# Altium project RK3588底板.PrjPcb (part 5 of 5)

## Sheet 12.SATA接口.SchDoc
size A4; SheetNumber: 12; SheetTotal: 13
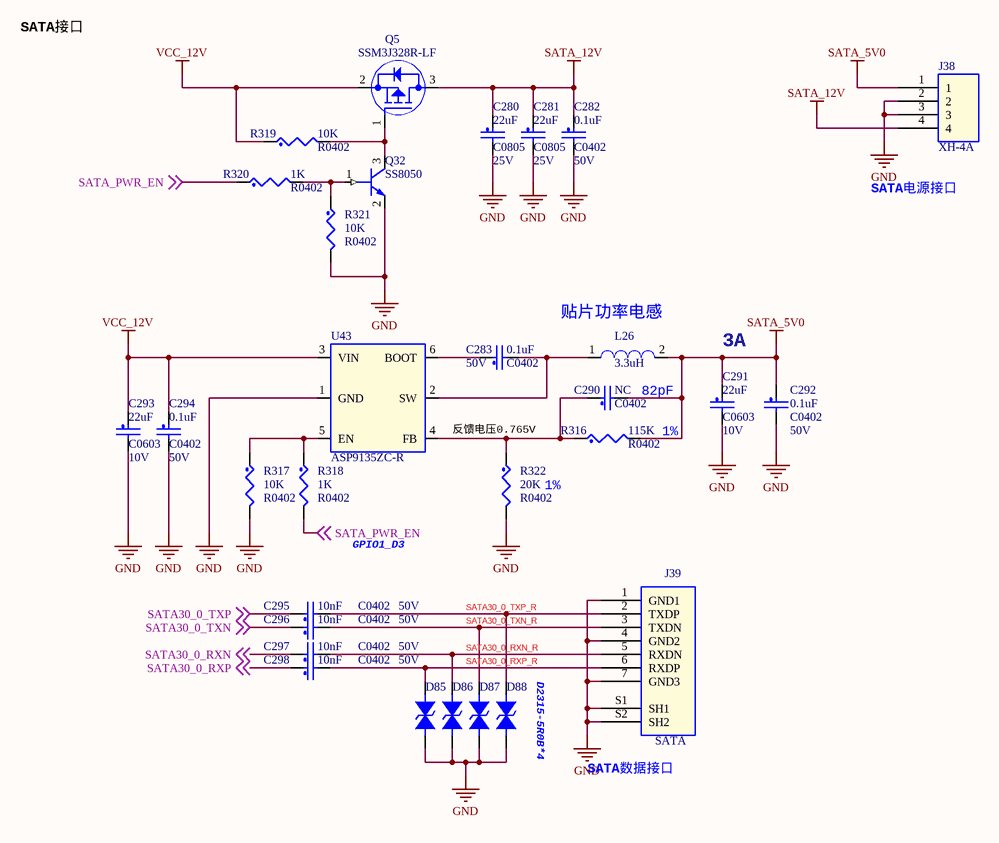
[diagram p11: 12.SATA接口.SchDoc]

### Parts
C280  22uF  Voltage: 25V  [C0805]
C281  22uF  Voltage: 25V  [C0805]
C282  0.1uF  Voltage: 50V  [C0402]
C283  0.1uF  Voltage: 50V  [C0402]
C290  NC  [C0402]
C291  22uF  Voltage: 10V  [C0603]
C292  0.1uF  Voltage: 50V  [C0402]
C293  22uF  Voltage: 10V  [C0603]
C294  0.1uF  Voltage: 50V  [C0402]
C295  10nF  Voltage: 50V  [C0402]
C296  10nF  Voltage: 50V  [C0402]
C297  10nF  Voltage: 50V  [C0402]
C298  10nF  Voltage: 50V  [C0402]
D85  D2315-5R0B  [esd0402]  (value not drawn)
D86  D2315-5R0B  [esd0402]  (value not drawn)
D87  D2315-5R0B  [esd0402]  (value not drawn)
D88  D2315-5R0B  [esd0402]  (value not drawn)
J38  XH-4A  [XH2p54-4p]
J39  SATA  [ssata_v]
L26  3.3uH  [l4520]
Q5  SSM3J328R-LF  [SOT23]
Q32  SS8050  [SOT23]
R316  115K  [R0402]
R317  10K  [R0402]
R318  1K  [R0402]
R319  10K  [R0402]
R320  1K  [R0402]
R321  10K  [R0402]
R322  20K  [R0402]
U43  ASP9135ZC-R  [SOT23_6]

### Nets
GND: C280.2 C281.2 C282.2 C291.2 C292.2 C293.2 C294.2 D85.1 D86.1 D87.1 D88.1 J38.2 J38.3 J39.1(GND1) J39.4(GND2) J39.7(GND3) J39.S1(SH1) J39.S2(SH2) Q32.2(EMITTER) R317.2 R321.2 R322.2 U43.1(GND)
SATA_5V0: C290.2 C291.1 C292.1 J38.1 L26.2 R316.2
SATA_12V: C280.1 C281.1 C282.1 J38.4 Q5.3(DRAIN)
VCC_12V: C293.1 C294.1 Q5.2(SOURCE) R319.1 U43.3(VIN)
SATA30_0_RXN: C297.1 ; off-sheet SATA30_0_RXN  [project net PCIE20_0_RXN]
SATA30_0_RXN_R: C297.2 D86.2 J39.5(RXDN)
SATA30_0_RXP: C298.1 ; off-sheet SATA30_0_RXP  [project net PCIE20_0_RXP]
SATA30_0_RXP_R: C298.2 D85.2 J39.6(RXDP)
SATA30_0_TXN: C296.1 ; off-sheet SATA30_0_TXN  [project net PCIE20_0_TXN]
SATA30_0_TXN_R: C296.2 D87.2 J39.3(TXDN)
SATA30_0_TXP: C295.1 ; off-sheet SATA30_0_TXP  [project net PCIE20_0_TXP]
SATA30_0_TXP_R: C295.2 D88.2 J39.2(TXDP)
SATA_PWR_EN: R318.2 R320.1 ; off-sheet SATA_PWR_EN  [project net GPIO1_D3]
NetC283_1: C283.1 U43.6(BOOT)
NetC283_2: C283.2 L26.1 U43.2(SW)
NetC290_1: C290.1 R316.1 R322.1 U43.4(FB)
NetQ5_1: Q5.1(GATE) Q32.3(COLLECTOR) R319.2
NetQ32_1: Q32.1(BASE) R320.2 R321.1
NetR317_1: R317.1 R318.1 U43.5(EN)

### Notes on the sheet
- SATA接口
- SATA电源接口
- (near L26) 贴片功率电感
- 3A
- 反馈电压0.765V
- 82pF
- 1%
- GPIO1_D3
- (near D88) D2315-5R0B*4
- (near J39) SATA数据接口

### Library data of the parts
C280 C281 = CAP_NP: CLASS: DISCRETE; 规格: 贴片电容22uF 20% 25V X5R 0805; 规格编号: 0805X226M250NT; 条码: EBF29060173; 品牌: 风华; 类别: 贴片电容0805; 规格书: 风华电容.pdf; 价格: 0.285631; 生命周期: 量产; PCB Footprint: C0805
C282 C283 = CAP_NP: CLASS: DISCRETE; 生命周期: 量产; 价格: 0.029826; 规格书: 风华电容.pdf; 类别: 贴片电容0402; 品牌: 风华; 条码: EBF29060118; 规格编号: 0402X104K500NT; 规格: 贴片电容0.1uF 10% 50V X5R 0402; PCB Footprint: C0402
C290 = CAP_NP: CLASS: DISCRETE; 规格: 贴片电容NC 预留; 条码: EBF29060149; 类别: 贴片电容0402; Voltage: NC; PCB Footprint: C0402
C291 C293 = CAP_NP: CLASS: DISCRETE; 生命周期: 量产; 价格: 0.078818; 规格书: 三星电容.pdf; 类别: 贴片电容0603; 品牌: 三星; 条码: EBF29060163; 规格编号: CL10A226MP8NUNE; 规格: 贴片电容22uF 20% 10V X5R 0603; PCB Footprint: C0603
C292 C294 = CAP_NP: CLASS: DISCRETE; 规格: 贴片电容0.1uF 10% 50V X5R 0402; 规格编号: 0402X104K500NT; 条码: EBF29060118; 品牌: 风华; 类别: 贴片电容0402; 规格书: 风华电容.pdf; 价格: 0.029826; 生命周期: 量产; PCB Footprint: C0402
C295-C298 = CAP_NP: CLASS: DISCRETE; 规格: 贴片电容10nF 10% 50V X7R 0402; 规格编号: CC0402KRX7R9BB103; 条码: EBF29060245; 品牌: 国巨; 类别: 贴片电容0402; 规格书: 国巨-贴片电容.pdf; 价格: 0.003808; 生命周期: 量产; PCB Footprint: C0402
D85-D88 = DIODE BI-DIR TRIG: 备注: 通用; 生命周期: 量产; 规格书: 千虹_D2315-5R0B.pdf; 类别: 贴片ESD; 品牌: 千虹; 条码: EBFCIS240517170922; 规格: 防静电保护ESD二极管 反向工作电压5V 击穿电压7V 钳位电压10.5V 结电容Cj 0.3pF; PCB Footprint: esd0402; 规格编号: D2315-5R0B
J38 = 1X4PIN: 可替代料: EBF29040012; 生命周期: 量产; 价格: 0.041116; 规格书: 博穆精密-XH2.54.pdf; 类别: XH连接器; 品牌: 博穆精密; 规格: 直针XH2.54-4P 间距2.54MM 拔插式 接插件 直插; PCB Footprint: XH2p54-4p; 条码: EBF29040012; 规格编号: XH-4A
J39 = SATA: 生命周期: 量产; 规格书: SATA_7PIN.pdf; 类别: SATA连接器; 品牌: 华宇创; 条码: EBF29040076; 规格编号: HYCW01-SATA07-205B; 规格: SATA 7PIN 全包开窗 A型; PCB Footprint: ssata_v
L26 = IND: CLASS: DISCRETE; 规格: 贴片电感3.3uH ±20% 3A 直流电阻69mΩ; 条码: EBF29050040; 品牌: 台庆; 类别: 贴片电感0402; 规格书: 台庆-功率电感.pdf; 生命周期: 量产; 规格编号: TMPC0402HP-3R3MG-Z02; 价格: 1.5992; PCB Footprint: l4520
Q5 = MOSFET_P: CLASS: IC; 丝印: KFH-XXX; 生命周期: 量产; 价格: 0.447836; 规格书: SSM3J328R-LF.pdf; 类别: P-MOS; 品牌: 东芝; 条码: EBF29280008; 规格编号: SSM3J328R LF; 规格: P沟道MOS 导通电阻29.8mΩ 电流3A 1.5V可驱动; PCB Footprint: SOT23
Q32 = NPN: CLASS: IC; 丝印: Y1; 生命周期: 量产; 价格: 0.086744; 规格书: 江苏长电-SS8050Y1.pdf; 类别: 贴片三极管SOT-23; 品牌: 江苏长电; 条码: EBF29090001; 规格: 贴片三极管SS8050 集电极电流1.5A 额定功率300mW NPN; PCB Footprint: SOT23; 规格编号: SS8050
R316 = RES: CLASS: DISCRETE; 规格: 贴片电阻115K 1% 1/16W 0402; 规格编号: AC0402FR-07115KL; 条码: EBF29070290; 品牌: 国巨; 类别: 贴片电阻0402; 规格书: YAGEO国巨厚膜无铅电阻.pdf; 价格: 0.006087; 生命周期: 量产; PCB Footprint: R0402
R317 R321 = RES: CLASS: DISCRETE; 生命周期: 量产; 价格: 0.002773; 规格书: 厚声-无铅厚膜电阻.pdf; 类别: 贴片电阻0402; 品牌: 厚声; 条码: EBF29070046; 规格编号: 0402WGF1002TCE; 规格: 贴片电阻10K 1% 1/16W 0402; PCB Footprint: R0402
R318 R320 = RES: CLASS: DISCRETE; 规格: 贴片电阻1K 1% 1/16W 0402; 规格编号: RI0402L1001FT; 条码: EBF29070050; 品牌: 合科泰; 类别: 贴片电阻0402; 规格书: 合科泰-RI系列电阻.pdf; 生命周期: 量产; PCB Footprint: R0402
R319 = RES: CLASS: DISCRETE; 规格: 贴片电阻10K 1% 1/16W 0402; 规格编号: 0402WGF1002TCE; 条码: EBF29070046; 品牌: 厚声; 类别: 贴片电阻0402; 规格书: 厚声-无铅厚膜电阻.pdf; 价格: 0.002773; 生命周期: 量产; PCB Footprint: R0402
R322 = RES: CLASS: DISCRETE; 规格: 贴片电阻20K 1% 1/16W 0402; 规格编号: 0402WGF2002TCE; 条码: EBF29070223; 品牌: 厚声; 类别: 贴片电阻0402; 规格书: 厚声-无铅厚膜电阻.pdf; 价格: 0.002473; 生命周期: 量产; PCB Footprint: R0402
U43 = TP6327GS6: 生命周期: 量产; 规格书: 安森德_ASP9135ZC-R.pdf; 类别: 电源管理-DCDC; 品牌: 安森德; 条码: EBFCIS240710113940; 规格: DC-DC电源芯片 可输出电流 3A 开关工作频率 600kHz 输出类型 ADJ 输入电压范围：4V-18V; 备注: RK3566金手指与BTB底板替换物料; 规格编号: ASP9135ZC-R; 可替代料: TP6327GS6; PCB Footprint: SOT23_6

## Sheet 13.GPIO扩展接口.SchDoc
size A4; SheetNumber: 13; SheetTotal: 13
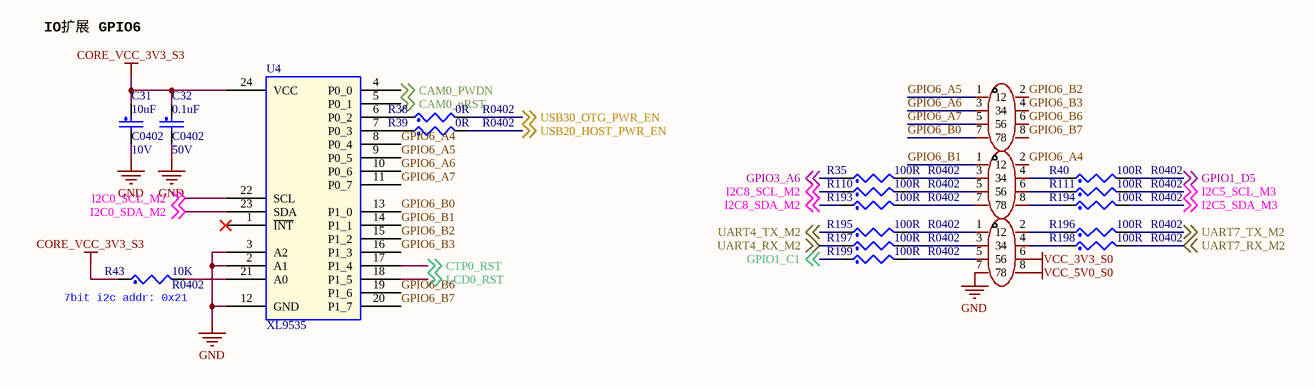
[diagram p12: 13.GPIO扩展接口.SchDoc]

### Parts
C31  10uF  Voltage: 10V  [C0402]
C32  0.1uF  Voltage: 50V  [C0402]
H1  HX PZ2.0-2x4P WT  [HDR-SMD_HX-PZ2.0-2X4P-WT]  (value not drawn)
H2  HX PZ2.0-2x4P WT  [HDR-SMD_HX-PZ2.0-2X4P-WT]  (value not drawn)
H3  HX PZ2.0-2x4P WT  [HDR-SMD_HX-PZ2.0-2X4P-WT]  (value not drawn)
R35  100R  [R0402]
R38  0R  [R0402]
R39  0R  [R0402]
R40  100R  [R0402]
R43  10K  [R0402]
R110  100R  [R0402]
R111  100R  [R0402]
R193  100R  [R0402]
R194  100R  [R0402]
R195  100R  [R0402]
R196  100R  [R0402]
R197  100R  [R0402]
R198  100R  [R0402]
R199  100R  [R0402]
U4  XL9535  [TSSOP24-0R65-7R80X4R40]

### Nets
CORE_VCC_3V3_S3: C31.1 C32.1 R43.1 U4.24(VCC)
GND: C31.2 C32.2 H3.7 U4.2(A1) U4.3(A2) U4.12(GND)
VCC_3V3_S0: H3.6
VCC_5V0_S0: H3.8
CAM0_nRST: U4.5(P0_1) ; off-sheet CAM0_nRST
CAM0_PWDN: U4.4(P0_0) ; off-sheet CAM0_PWDN
CTP0_RST: U4.17(P1_4) ; off-sheet CTP0_RST
GPIO1_C1: R199.1 ; off-sheet GPIO1_C1
GPIO1_D5: R40.2 ; off-sheet GPIO1_D5
GPIO3_A6: R35.1 ; off-sheet GPIO3_A6
GPIO6_A4: H2.2 U4.8(P0_4)
GPIO6_A5: H1.1 U4.9(P0_5)
GPIO6_A6: H1.3 U4.10(P0_6)
GPIO6_A7: H1.5 U4.11(P0_7)
GPIO6_B0: H1.7 U4.13(P1_0)
GPIO6_B1: H2.1 U4.14(P1_1)
GPIO6_B2: H1.2 U4.15(P1_2)
GPIO6_B3: H1.4 U4.16(P1_3)
GPIO6_B6: H1.6 U4.19(P1_6)
GPIO6_B7: H1.8 U4.20(P1_7)
I2C0_SCL_M2: U4.22(SCL) ; off-sheet I2C0_SCL_M2
I2C0_SDA_M2: U4.23(SDA) ; off-sheet I2C0_SDA_M2
I2C5_SCL_M3: R111.2 ; off-sheet I2C5_SCL_M3
I2C5_SDA_M3: R194.2 ; off-sheet I2C5_SDA_M3
I2C8_SCL_M2: R110.1 ; off-sheet I2C8_SCL_M2
I2C8_SDA_M2: R193.1 ; off-sheet I2C8_SDA_M2
LCD0_RST: U4.18(P1_5) ; off-sheet LCD0_RST
UART4_RX_M2: R197.1 ; off-sheet UART4_RX_M2
UART4_TX_M2: R195.1 ; off-sheet UART4_TX_M2
UART7_RX_M2: R198.2 ; off-sheet UART7_RX_M2
UART7_TX_M2: R196.2 ; off-sheet UART7_TX_M2
USB20_HOST_PWR_EN: R39.2 ; off-sheet USB20_HOST_PWR_EN
USB30_OTG_PWR_EN: R38.2 ; off-sheet USB30_OTG_PWR_EN
NetH2_3: H2.3 R35.2
NetH2_4: H2.4 R40.1
NetH2_5: H2.5 R110.2
NetH2_6: H2.6 R111.1
NetH2_7: H2.7 R193.2
NetH2_8: H2.8 R194.1
NetH3_1: H3.1 R195.2
NetH3_2: H3.2 R196.1
NetH3_3: H3.3 R197.2
NetH3_4: H3.4 R198.1
NetH3_5: H3.5 R199.2
NetR38_1: R38.1 U4.6(P0_2)
NetR39_1: R39.1 U4.7(P0_3)
NetR43_2: R43.2 U4.21(A0)

Not connected (* = marked no-connect by the designer): U4 1(~{INT})*

### Notes on the sheet
- IO扩展 GPIO6
- (near R43) 7bit i2c addr: 0x21

### Library data of the parts
C31 = CAP_NP: CLASS: DISCRETE; 生命周期: 量产; 价格: 0.518415; 规格书: 三星电容.pdf; 类别: 贴片电容0402; 品牌: 三星; 条码: EBF29060247; 规格编号: CL05A106MP8NUB8; 规格: 贴片电容10uF 20% 10V X5R 0402; PCB Footprint: C0402
C32 = CAP_NP: as C282 on sheet 12.SATA接口; PCB Footprint: C0402
H1-H3 = HX PZ2.0-2x4P WT: Manufacturer: hanxia(韩下); Add into BOM: yes; Pin Structure: 2x4P; Pitch: 2mm; Circluar Pins/Square Pins: 方针; Current Rating: 1.5A; Voltage Rating (Max): 500V; Symbol: HX PZ2.0-2X4P WT; Device: HX PZ2.0-2x4P WT; LCSC Part Name: 配套排母：HX PM2.0-2x4P系列 2x4P 间距:2mm 方针 卧贴; Supplier Part: C46061659; Manufacturer Part: HX PZ2.0-2x4P WT; Supplier Footprint: SMD,P=2mm,卧贴; Datasheet: https://item.szlcsc.com/datasheet/HX%2520PZ2.0-2x4P%2520WT/48170519.html; Supplier: LCSC; Convert to PCB: yes; Row Spacing: 2mm; Mounting Type: 卧贴; Number of Rows: 双排; Number of Pins: 8P; Length of Mating Pin: 4mm; Insulation Height: 2mm; Length of End Connection Pin: -; Contact Material: 黄铜; Contact Plating: 金; Operating Temperature: -40℃~+105℃; Color: 黑色; Supplementary Features: -
R35 R38-R40 R43 R110 R111 R193-R199 = RES: as R317 on sheet 12.SATA接口; PCB Footprint: R0402
U4 = XL9535: 丝印: XL9535D; 备注: RK3588 BTB底板; 生命周期: 量产; 价格: 1.75; 规格书: 信路达_XL9535.pdf; 类别: IO拓展; 品牌: 信路达; 条码: EBFCIS230803102100; 规格: I2C接口 16个双向输入输出引脚 支持中断输出 工作电压2.3V~5.5V; 规格编号: XL9535; PCB Footprint: TSSOP24-0R65-7R80X4R40

## Nets that join several sheets
CORE_VCC_1V8_S0: 1.BTB (BTB_1.12 BTB_1.89), 2.电源 (R273.2), 4.以太网_eth1 (R381.2), 6.音频_FAN_ADC_LED (L4.1), 8.HDMI2 (6 pins)
CORE_VCC_1V8_S3: 1.BTB (BTB_1.11 BTB_1.90), 3.DEBUG_SD卡_RTC_按键 (R3.1 R276.1 R284.1), 6.音频_FAN_ADC_LED (R119.1)
CORE_VCC_3V3_S0: 1.BTB (BTB_1.9 BTB_1.92), 5.USB3 (R77.1), 6.音频_FAN_ADC_LED (L5.1)
CORE_VCC_3V3_S3: 1.BTB (BTB_1.8 BTB_1.93), 3.DEBUG_SD卡_RTC_按键 (6 pins), 5.USB3 (C81.1 R87.1 U5.3 U5.4), 11.MIPI DSI_CSI (U40.5), 13.GPIO扩展接口 (C31.1 C32.1 R43.1 U4.24)
CORE_VCCA_1V8_S0: 1.BTB (BTB_1.10 BTB_1.91 R20.2 R21.2), 6.音频_FAN_ADC_LED (L14.1)
GND: 1.BTB (111 pins), 2.电源 (42 pins), 3.DEBUG_SD卡_RTC_按键 (51 pins), 4.以太网_eth1 (34 pins), 5.USB3 (53 pins), 6.音频_FAN_ADC_LED (63 pins), 7.HDMI2 (29 pins), 8.HDMI2 (29 pins), 9.PCIE3 (92 pins), 10.PCIE2 (20 pins), 11.MIPI DSI_CSI (29 pins), 12.SATA接口 (23 pins), 13.GPIO扩展接口 (6 pins)
VCC4V0_SYS: 1.BTB (12 pins), 2.电源 (10 pins)
VCC5V0_USB_S0: 2.电源 (5 pins), 5.USB3 (7 pins)
VCC_3V3_S0: 1.BTB (8 pins), 2.电源 (7 pins), 3.DEBUG_SD卡_RTC_按键 (C35.2 C36.2 U18.7 U18.10), 4.以太网_eth1 (R382.2 R383.2), 5.USB3 (R33.1 R34.1), 6.音频_FAN_ADC_LED (L15.1 R128.1), 7.HDMI2 (7 pins), 8.HDMI2 (D49.2 R178.1 R179.1), 9.PCIE3 (R246.2 R328.1), 13.GPIO扩展接口 (H3.6)
VCC_5V0_S0: 2.电源 (5 pins), 6.音频_FAN_ADC_LED (R127.1 R342.1 R348.1), 7.HDMI2 (D26.2 Q14.1), 8.HDMI2 (D33.2), 9.PCIE3 (C184.1 C185.1 U27.1), 11.MIPI DSI_CSI (R37.1 U39.5), 13.GPIO扩展接口 (H3.8)
VCC_12V: 2.电源 (19 pins), 6.音频_FAN_ADC_LED (R131.1 R341.1 R347.1), 9.PCIE3 (8 pins), 10.PCIE2 (C249.1 C250.1 U17.3), 12.SATA接口 (5 pins)
CAM0_nRST: 11.MIPI DSI_CSI (J1.22), 13.GPIO扩展接口 (U4.5)
CAM0_PWDN: 11.MIPI DSI_CSI (J1.15), 13.GPIO扩展接口 (U4.4)
CTP0_INT: 1.BTB (BTB_3.4), 11.MIPI DSI_CSI (J14.11 R301.2)
CTP0_RST: 11.MIPI DSI_CSI (J14.12 R303.2), 13.GPIO扩展接口 (U4.17)
EARPHONE_CTL: 1.BTB (BTB_3.15), 6.音频_FAN_ADC_LED (R326.2)
FAN_CTRL: 1.BTB (BTB_3.35), 6.音频_FAN_ADC_LED (R133.1)
FUSB302_INT: 1.BTB (BTB_1.53), 5.USB3 (R87.2 U5.5)
GMAC0_MCLKINOUT: 1.BTB (BTB_1.63), 4.以太网_eth1 (R67.1 R68.1)
GMAC0_MDC: 1.BTB (BTB_1.55), 4.以太网_eth1 (R61.2 U3.13)
GMAC0_MDIO: 1.BTB (BTB_1.54), 4.以太网_eth1 (R62.2 U3.14)
GMAC0_RSTn: 1.BTB (BTB_1.46), 4.以太网_eth1 (D7.1)
GMAC0_RXCLK: 1.BTB (BTB_1.38), 4.以太网_eth1 (R56.1 R59.1)
GMAC0_RXD0: 1.BTB (BTB_1.40), 4.以太网_eth1 (R48.2 R51.1)
GMAC0_RXD1: 1.BTB (BTB_1.39), 4.以太网_eth1 (R49.2 R52.1)
GMAC0_RXD2: 1.BTB (BTB_1.42), 4.以太网_eth1 (R54.1 R58.1)
GMAC0_RXD3: 1.BTB (BTB_1.41), 4.以太网_eth1 (R50.2 R55.1)
GMAC0_RXDV_CRS: 1.BTB (BTB_1.37), 4.以太网_eth1 (R57.1 R60.1)
GMAC0_TXCLK: 1.BTB (BTB_1.61), 4.以太网_eth1 (U3.20)
GMAC0_TXD0: 1.BTB (BTB_1.59), 4.以太网_eth1 (U3.18)
GMAC0_TXD1: 1.BTB (BTB_1.60), 4.以太网_eth1 (U3.17)
GMAC0_TXD2: 1.BTB (BTB_1.57), 4.以太网_eth1 (U3.16)
GMAC0_TXD3: 1.BTB (BTB_1.58), 4.以太网_eth1 (U3.15)
GMAC0_TXEN: 1.BTB (BTB_1.62), 4.以太网_eth1 (U3.19)
GPIO0_A0: 1.BTB (BTB_3.3), 6.音频_FAN_ADC_LED (R120.2)
GPIO0_B2: 1.BTB (BTB_3.19), 3.DEBUG_SD卡_RTC_按键 (R277.2)
GPIO0_B7: 1.BTB (BTB_3.18), 10.PCIE2 (R140.2)
GPIO0_C6: 1.BTB (BTB_3.16), 10.PCIE2 (R146.2)
GPIO1_A2: 1.BTB (BTB_3.55), 11.MIPI DSI_CSI (J14.13)
GPIO1_A4: 1.BTB (BTB_3.54), 7.HDMI2 (R169.1)
GPIO1_A7: 1.BTB (BTB_3.46), 8.HDMI2 (R190.1)
GPIO1_B0: 1.BTB (BTB_3.42), 5.USB3 (R92.2)
GPIO1_B1: 1.BTB (BTB_3.47), 5.USB3 (R94.2)
GPIO1_C0: 1.BTB (BTB_3.32), 11.MIPI DSI_CSI (R306.1)
GPIO1_C1: 1.BTB (BTB_3.30), 13.GPIO扩展接口 (R199.1)
GPIO1_C6: 1.BTB (BTB_3.39), 6.音频_FAN_ADC_LED (R334.1)
GPIO1_D3: 1.BTB (BTB_3.40), 12.SATA接口 (R318.2 R320.1)
GPIO1_D5: 1.BTB (BTB_3.29), 13.GPIO扩展接口 (R40.2)
GPIO2_C5: 1.BTB (BTB_3.8), 9.PCIE3 (R221.2)
GPIO3_A6: 1.BTB (BTB_2.89), 13.GPIO扩展接口 (R35.1)
GPIO3_D5: 1.BTB (BTB_3.5), 6.音频_FAN_ADC_LED (R345.1 R351.1)
GPIO4_A3: 1.BTB (BTB_2.81), 5.USB3 (R93.1)
GPIO4_B1: 1.BTB (BTB_2.65), 9.PCIE3 (R137.1)
GPIO4_C6: 1.BTB (BTB_1.65), 9.PCIE3 (R251.2 R256.1)
HDMI_TX0_CEC_M0: 1.BTB (BTB_2.66), 7.HDMI2 (Q14.2 R170.2)
HDMI_TX0_D0N: 1.BTB (BTB_4.37), 7.HDMI2 (C136.1)
HDMI_TX0_D0P: 1.BTB (BTB_4.36), 7.HDMI2 (C135.1)
HDMI_TX0_D1N: 1.BTB (BTB_4.35), 7.HDMI2 (C134.1)
HDMI_TX0_D1P: 1.BTB (BTB_4.34), 7.HDMI2 (C133.1)
HDMI_TX0_D2N: 1.BTB (BTB_4.33), 7.HDMI2 (C132.1)
HDMI_TX0_D2P: 1.BTB (BTB_4.32), 7.HDMI2 (C131.1)
HDMI_TX0_D3N: 1.BTB (BTB_4.39), 7.HDMI2 (C138.1)
HDMI_TX0_D3P: 1.BTB (BTB_4.38), 7.HDMI2 (C137.1)
HDMI_TX0_HPD_M0: 1.BTB (BTB_3.56), 7.HDMI2 (Q8.3 R157.2)
HDMI_TX0_SBDN: 1.BTB (BTB_4.42), 7.HDMI2 (C140.1)
HDMI_TX0_SBDP: 1.BTB (BTB_4.41), 7.HDMI2 (C139.1)
HDMI_TX0_SCL_M0: 1.BTB (BTB_2.79), 7.HDMI2 (Q6.2 R151.2)
HDMI_TX0_SDA_M0: 1.BTB (BTB_2.88), 7.HDMI2 (C142.2 Q7.2 R154.2)
HDMI_TX1_CEC_M0: 1.BTB (BTB_3.7), 8.HDMI2 (Q23.2 R191.2)
HDMI_TX1_D0N: 1.BTB (BTB_4.25), 8.HDMI2 (C148.1)
HDMI_TX1_D0P: 1.BTB (BTB_4.24), 8.HDMI2 (C147.1)
HDMI_TX1_D1N: 1.BTB (BTB_4.23), 8.HDMI2 (C146.1)
HDMI_TX1_D1P: 1.BTB (BTB_4.22), 8.HDMI2 (C145.1)
HDMI_TX1_D2N: 1.BTB (BTB_4.21), 8.HDMI2 (C144.1)
HDMI_TX1_D2P: 1.BTB (BTB_4.20), 8.HDMI2 (C143.1)
HDMI_TX1_D3N: 1.BTB (BTB_4.27), 8.HDMI2 (C150.1)
HDMI_TX1_D3P: 1.BTB (BTB_4.26), 8.HDMI2 (C149.1)
HDMI_TX1_HPD_M0: 1.BTB (BTB_3.48), 8.HDMI2 (Q17.3 R178.2)
HDMI_TX1_SBDN: 1.BTB (BTB_4.30), 8.HDMI2 (C152.1)
HDMI_TX1_SBDP: 1.BTB (BTB_4.29), 8.HDMI2 (C151.1)
HDMI_TX1_SCL_M0: 1.BTB (BTB_1.45), 8.HDMI2 (Q15.2 R172.2)
HDMI_TX1_SDA_M0: 1.BTB (BTB_1.44), 8.HDMI2 (C154.2 Q16.2 R175.2)
HP_BUTTON_DET: 1.BTB (BTB_4.86), 6.音频_FAN_ADC_LED (C121.1 R116.2 R118.1)
I2C0_SCL_M2: 1.BTB (BTB_1.47), 3.DEBUG_SD卡_RTC_按键 (U35.6), 11.MIPI DSI_CSI (J1.6), 13.GPIO扩展接口 (U4.22)
I2C0_SDA_M2: 1.BTB (BTB_3.12), 3.DEBUG_SD卡_RTC_按键 (U35.5), 11.MIPI DSI_CSI (J1.5), 13.GPIO扩展接口 (U4.23)
I2C1_SCL_M2: 1.BTB (BTB_3.13), 5.USB3 (U5.6)
I2C1_SDA_M2: 1.BTB (BTB_3.11), 5.USB3 (U5.7)
I2C2_SCL_M4: 1.BTB (BTB_3.53 R26.2), 11.MIPI DSI_CSI (J14.9)
I2C2_SDA_M4: 1.BTB (BTB_3.52 R25.2), 11.MIPI DSI_CSI (J14.10)
I2C5_SCL_M3: 1.BTB (BTB_3.24 R27.2), 13.GPIO扩展接口 (R111.2)
I2C5_SDA_M3: 1.BTB (BTB_3.44 R28.2), 13.GPIO扩展接口 (R194.2)
I2C7_SCL_M0: 1.BTB (BTB_3.23 R29.2), 6.音频_FAN_ADC_LED (U16.28)
I2C7_SDA_M0: 1.BTB (BTB_3.31 R30.2), 6.音频_FAN_ADC_LED (U16.27)
I2C8_SCL_M2: 1.BTB (BTB_3.21 R31.2), 13.GPIO扩展接口 (R110.1)
I2C8_SDA_M2: 1.BTB (BTB_3.22 R32.2), 13.GPIO扩展接口 (R193.1)
I2S0_LRCK: 1.BTB (BTB_3.38), 6.音频_FAN_ADC_LED (U16.7)
I2S0_MCLK: 1.BTB (BTB_3.34), 6.音频_FAN_ADC_LED (U16.1)
I2S0_SCLK: 1.BTB (BTB_3.36), 6.音频_FAN_ADC_LED (U16.5)
I2S0_SDI0: 1.BTB (BTB_3.41), 6.音频_FAN_ADC_LED (U16.8)
I2S0_SDO0: 1.BTB (BTB_3.37), 6.音频_FAN_ADC_LED (U16.6)
LCD0_RST: 11.MIPI DSI_CSI (J14.15), 13.GPIO扩展接口 (U4.18)
MIPI_DPHY0_RX_CLKN: 1.BTB (BTB_2.13), 11.MIPI DSI_CSI (J1.10)
MIPI_DPHY0_RX_CLKP: 1.BTB (BTB_2.12), 11.MIPI DSI_CSI (J1.9)
MIPI_DPHY0_RX_D0N: 1.BTB (BTB_2.17), 11.MIPI DSI_CSI (J1.12)
MIPI_DPHY0_RX_D0P: 1.BTB (BTB_2.18), 11.MIPI DSI_CSI (J1.11)
MIPI_DPHY0_RX_D1N: 1.BTB (BTB_2.15), 11.MIPI DSI_CSI (J1.8)
MIPI_DPHY0_RX_D1P: 1.BTB (BTB_2.16), 11.MIPI DSI_CSI (J1.7)
MIPI_DPHY0_RX_D2N: 1.BTB (BTB_2.10), 11.MIPI DSI_CSI (J1.17)
MIPI_DPHY0_RX_D2P: 1.BTB (BTB_2.9), 11.MIPI DSI_CSI (J1.16)
MIPI_DPHY0_RX_D3N: 1.BTB (BTB_2.8), 11.MIPI DSI_CSI (J1.20)
MIPI_DPHY0_RX_D3P: 1.BTB (BTB_2.7), 11.MIPI DSI_CSI (J1.19)
MIPI_DPHY0_TX_CLKN: 1.BTB (BTB_2.25), 11.MIPI DSI_CSI (J14.24)
MIPI_DPHY0_TX_CLKP: 1.BTB (BTB_2.26), 11.MIPI DSI_CSI (J14.23)
MIPI_DPHY0_TX_D0N: 1.BTB (BTB_2.30), 11.MIPI DSI_CSI (J14.27)
MIPI_DPHY0_TX_D0P: 1.BTB (BTB_2.31), 11.MIPI DSI_CSI (J14.26)
MIPI_DPHY0_TX_D1N: 1.BTB (BTB_2.28), 11.MIPI DSI_CSI (J14.21)
MIPI_DPHY0_TX_D1P: 1.BTB (BTB_2.29), 11.MIPI DSI_CSI (J14.20)
MIPI_DPHY0_TX_D2N: 1.BTB (BTB_2.22), 11.MIPI DSI_CSI (J14.18)
MIPI_DPHY0_TX_D2P: 1.BTB (BTB_2.23), 11.MIPI DSI_CSI (J14.17)
MIPI_DPHY0_TX_D3N: 1.BTB (BTB_2.20), 11.MIPI DSI_CSI (J14.30)
MIPI_DPHY0_TX_D3P: 1.BTB (BTB_2.21), 11.MIPI DSI_CSI (J14.29)
PCIE20_0_RXN: 1.BTB (BTB_3.98), 12.SATA接口 (C297.1)
PCIE20_0_RXP: 1.BTB (BTB_3.97), 12.SATA接口 (C298.1)
PCIE20_0_TXN: 1.BTB (BTB_3.95), 12.SATA接口 (C296.1)
PCIE20_0_TXP: 1.BTB (BTB_3.96), 12.SATA接口 (C295.1)
PCIE20_1_REFCLKN: 1.BTB (BTB_3.85), 10.PCIE2 (J13.49)
PCIE20_1_REFCLKP: 1.BTB (BTB_3.84), 10.PCIE2 (J13.47)
PCIE20_1_RXN: 1.BTB (BTB_3.88), 10.PCIE2 (J13.43)
PCIE20_1_RXP: 1.BTB (BTB_3.87), 10.PCIE2 (J13.41)
PCIE20_1_TXN: 1.BTB (BTB_3.90), 10.PCIE2 (C252.1)
PCIE20_1_TXP: 1.BTB (BTB_3.89), 10.PCIE2 (C251.1)
PCIE30_PORT0_REF_CLKN: 1.BTB (BTB_3.77), 9.PCIE3 (R217.2 R219.1)
PCIE30_PORT0_REF_CLKP: 1.BTB (BTB_3.76), 9.PCIE3 (R216.2 R220.1)
PCIE30_PORT0_RX0N: 1.BTB (BTB_3.82), 9.PCIE3 (J19.41)
PCIE30_PORT0_RX0P: 1.BTB (BTB_3.81), 9.PCIE3 (J19.43)
PCIE30_PORT0_RX1N: 1.BTB (BTB_3.80), 9.PCIE3 (J19.29)
PCIE30_PORT0_RX1P: 1.BTB (BTB_3.79), 9.PCIE3 (J19.31)
PCIE30_PORT0_TX0N: 1.BTB (BTB_3.74), 9.PCIE3 (C177.1)
PCIE30_PORT0_TX0P: 1.BTB (BTB_3.73), 9.PCIE3 (C178.1)
PCIE30_PORT0_TX1N: 1.BTB (BTB_3.72), 9.PCIE3 (C175.1)
PCIE30_PORT0_TX1P: 1.BTB (BTB_3.71), 9.PCIE3 (C176.1)
PCIE30_PORT1_REF_CLKN: 1.BTB (BTB_3.59), 9.PCIE3 (R243.2 R244.1)
PCIE30_PORT1_REF_CLKP: 1.BTB (BTB_3.60), 9.PCIE3 (R242.2 R245.1)
PCIE30_PORT1_RX0N: 1.BTB (BTB_3.69), 9.PCIE3 (J20.A17)
PCIE30_PORT1_RX0P: 1.BTB (BTB_3.68), 9.PCIE3 (J20.A16)
PCIE30_PORT1_RX1N: 1.BTB (BTB_3.67), 9.PCIE3 (J20.A22)
PCIE30_PORT1_RX1P: 1.BTB (BTB_3.66), 9.PCIE3 (J20.A21)
PCIE30_PORT1_TX0N: 1.BTB (BTB_3.65), 9.PCIE3 (C190.1)
PCIE30_PORT1_TX0P: 1.BTB (BTB_3.64), 9.PCIE3 (C189.1)
PCIE30_PORT1_TX1N: 1.BTB (BTB_3.63), 9.PCIE3 (C192.1)
PCIE30_PORT1_TX1P: 1.BTB (BTB_3.62), 9.PCIE3 (C191.1)
PCIE30X1_0_CLKREQN_M0: 1.BTB (BTB_1.49), 10.PCIE2 (R145.1)
PCIE30X1_0_PERSTN_M0: 1.BTB (BTB_3.27), 10.PCIE2 (R144.2)
PCIE30X1_0_WAKEN_M0: 1.BTB (BTB_3.17), 10.PCIE2 (R148.1)
PCIE30X2_CLKREQN_M1: 1.BTB (BTB_2.73), 9.PCIE3 (R248.1)
PCIE30X2_PERSTN_M1: 1.BTB (BTB_2.75), 9.PCIE3 (J20.A11)
PCIE30X2_WAKEN_M1: 1.BTB (BTB_2.74), 9.PCIE3 (R247.1)
PCIE30X4_CLKREQN_M1: 1.BTB (BTB_2.72), 9.PCIE3 (J19.52)
PCIE30X4_PERSTN_M1: 1.BTB (BTB_2.77), 9.PCIE3 (J19.50)
PCIE30X4_WAKEN_M1: 1.BTB (BTB_2.84), 9.PCIE3 (J19.54)
PWR_ON: 1.BTB (BTB_1.84), 3.DEBUG_SD卡_RTC_按键 (R19.2)
RECOVERY_KEY: 1.BTB (BTB_4.84), 3.DEBUG_SD卡_RTC_按键 (R2.2)
RESETn: 1.BTB (BTB_1.85), 3.DEBUG_SD卡_RTC_按键 (R5.2)
RTC_INT: 1.BTB (BTB_3.28), 3.DEBUG_SD卡_RTC_按键 (R3.2 U35.3)
SARADC_IN0_BOOT: 1.BTB (BTB_4.85), 3.DEBUG_SD卡_RTC_按键 (R1.2)
SDMMC_CLK: 1.BTB (BTB_4.49), 3.DEBUG_SD卡_RTC_按键 (R280.1)
SDMMC_CMD: 1.BTB (BTB_4.46), 3.DEBUG_SD卡_RTC_按键 (R279.1)
SDMMC_D0: 1.BTB (BTB_4.47), 3.DEBUG_SD卡_RTC_按键 (R281.1)
SDMMC_D1: 1.BTB (BTB_4.48), 3.DEBUG_SD卡_RTC_按键 (R282.1)
SDMMC_D2: 1.BTB (BTB_4.44), 3.DEBUG_SD卡_RTC_按键 (R275.1)
SDMMC_D3: 1.BTB (BTB_4.45), 3.DEBUG_SD卡_RTC_按键 (R278.1)
SDMMC_DET: 1.BTB (BTB_3.26), 3.DEBUG_SD卡_RTC_按键 (R283.1 R284.2)
TYPEC0_SBU1: 1.BTB (BTB_4.81), 5.USB3 (C84.2)
TYPEC0_SBU2: 1.BTB (BTB_4.82), 5.USB3 (C85.2)
TYPEC0_SSRX1N: 1.BTB (BTB_4.7), 5.USB3 (R86.2)
TYPEC0_SSRX1P: 1.BTB (BTB_4.8), 5.USB3 (R85.2)
TYPEC0_SSRX2N: 1.BTB (BTB_2.48), 5.USB3 (R91.2)
TYPEC0_SSRX2P: 1.BTB (BTB_2.49), 5.USB3 (R89.2)
TYPEC0_SSTX1N: 1.BTB (BTB_4.6), 5.USB3 (C80.2)
TYPEC0_SSTX1P: 1.BTB (BTB_4.5), 5.USB3 (C79.2)
TYPEC0_SSTX2N: 1.BTB (BTB_2.47), 5.USB3 (C83.2)
TYPEC0_SSTX2P: 1.BTB (BTB_2.46), 5.USB3 (C82.2)
TYPEC0_USB20_OTG_DM: 1.BTB (BTB_4.77), 5.USB3 (R82.2)
TYPEC0_USB20_OTG_DP: 1.BTB (BTB_4.76), 5.USB3 (R81.2)
TYPEC0_USB20_OTG_ID: 1.BTB (BTB_4.79), 5.USB3 (R78.2)
TYPEC0_USB20_VBUSDET: 1.BTB (BTB_4.80), 5.USB3 (R77.2)
TYPEC1_SSRX1N: 1.BTB (BTB_4.18), 5.USB3 (R83.2)
TYPEC1_SSRX1P: 1.BTB (BTB_4.17), 5.USB3 (R84.2)
TYPEC1_SSTX1N: 1.BTB (BTB_4.15), 5.USB3 (C75.2)
TYPEC1_SSTX1P: 1.BTB (BTB_4.16), 5.USB3 (C76.2)
TYPEC1_USB20_OTG_DM: 1.BTB (BTB_4.70), 5.USB3 (R79.2)
TYPEC1_USB20_OTG_DP: 1.BTB (BTB_4.69), 5.USB3 (R80.2)
TYPEC1_USB20_VBUSDET: 1.BTB (BTB_4.67), 5.USB3 (C253.1 R149.1 R150.2)
UART2_RX_M0_DEBUG: 1.BTB (BTB_1.48), 3.DEBUG_SD卡_RTC_按键 (U34.4)
UART2_TX_M0_DEBUG: 1.BTB (BTB_3.20), 3.DEBUG_SD卡_RTC_按键 (U33.2)
UART4_RX_M2: 1.BTB (BTB_3.45), 13.GPIO扩展接口 (R197.1)
UART4_TX_M2: 1.BTB (BTB_3.43), 13.GPIO扩展接口 (R195.1)
UART7_RX_M2: 1.BTB (BTB_3.25), 13.GPIO扩展接口 (R198.2)
UART7_TX_M2: 1.BTB (BTB_3.49), 13.GPIO扩展接口 (R196.2)
USB20_HOST0_DM: 1.BTB (BTB_4.62), 5.USB3 (R88.2)
USB20_HOST0_DP: 1.BTB (BTB_4.61), 5.USB3 (R90.2)
USB20_HOST1_DM: 1.BTB (BTB_4.65), 10.PCIE2 (R143.1)
USB20_HOST1_DP: 1.BTB (BTB_4.64), 10.PCIE2 (R142.1)
USB20_HOST_PWR_EN: 5.USB3 (R324.1), 13.GPIO扩展接口 (R39.2)
USB30_OTG_PWR_EN: 5.USB3 (R96.1), 13.GPIO扩展接口 (R38.2)